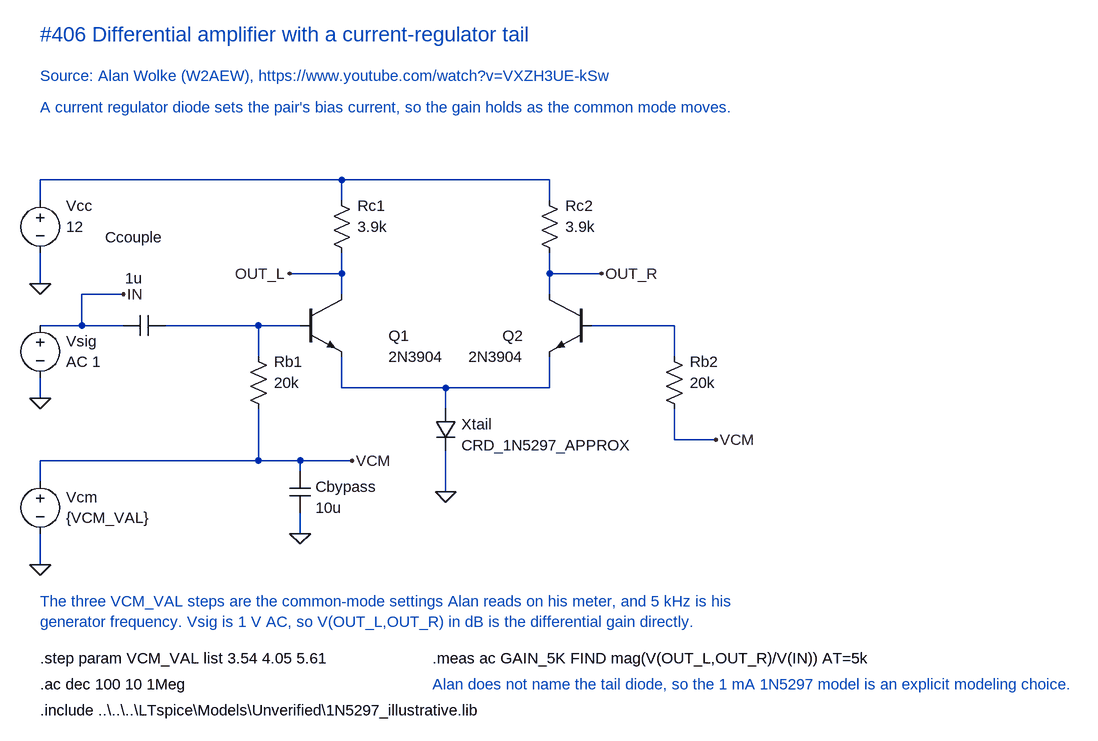
[diagram p0: schematic Differential amplifier - Current-regulator tail.asc]
Differential amplifier - Current-regulator tail.asc, the LTspice schematic file:
Version 4.1
SHEET 1 1500 1150
WIRE 96 272 96 304
WIRE 560 272 96 272
WIRE 880 272 560 272
WIRE 560 304 560 272
WIRE 880 304 880 272
WIRE 560 448 560 384
WIRE 880 448 880 384
WIRE 480 416 560 416
WIRE 960 416 880 416
WIRE 560 592 560 544
WIRE 880 592 560 592
WIRE 880 592 880 544
WIRE 720 624 720 592
WIRE 720 752 720 688
WIRE 224 496 96 496
WIRE 496 496 288 496
WIRE 432 544 432 496
WIRE 160 448 160 496
WIRE 224 448 160 448
WIRE 944 496 1072 496
WIRE 1072 496 1072 544
WIRE 432 704 432 624
WIRE 1072 672 1072 624
WIRE 1136 672 1072 672
WIRE 96 432 96 384
WIRE 96 608 96 576
WIRE 96 704 96 736
WIRE 496 704 96 704
WIRE 576 704 496 704
WIRE 496 720 496 704
WIRE 496 816 496 784
WIRE 96 864 96 816
FLAG 96 432 0
FLAG 96 608 0
FLAG 96 864 0
FLAG 496 816 0
FLAG 720 752 0
FLAG 224 448 IN
FLAG 480 416 OUT_L
FLAG 960 416 OUT_R
FLAG 576 704 VCM
FLAG 1136 672 VCM
SYMBOL voltage 96 288 R0
WINDOW 0 40 24 Left 2
WINDOW 3 40 56 Left 2
SYMATTR InstName Vcc
SYMATTR Value 12
SYMBOL voltage 96 480 R0
WINDOW 0 40 40 Left 2
WINDOW 3 40 72 Left 2
SYMATTR InstName Vsig
SYMATTR Value AC 1
SYMBOL voltage 96 720 R0
WINDOW 0 40 40 Left 2
WINDOW 3 40 72 Left 2
SYMATTR InstName Vcm
SYMATTR Value {VCM_VAL}
SYMBOL cap 288 480 R90
WINDOW 0 -104 48 VBottom 2
WINDOW 3 -72 48 VTop 2
SYMATTR InstName Ccouple
SYMATTR Value 1u
SYMBOL cap 480 720 R0
WINDOW 0 40 24 Left 2
WINDOW 3 40 56 Left 2
SYMATTR InstName Cbypass
SYMATTR Value 10u
SYMBOL res 544 288 R0
WINDOW 0 40 24 Left 2
WINDOW 3 40 56 Left 2
SYMATTR InstName Rc1
SYMATTR Value 3.9k
SYMBOL res 864 288 R0
WINDOW 0 40 24 Left 2
WINDOW 3 40 56 Left 2
SYMATTR InstName Rc2
SYMATTR Value 3.9k
SYMBOL npn 496 448 R0
WINDOW 0 136 64 Left 2
WINDOW 3 136 96 Left 2
SYMATTR InstName Q1
SYMATTR Value 2N3904
SYMBOL npn 944 448 M0
WINDOW 0 104 64 Left 2
WINDOW 3 104 96 Left 2
SYMATTR InstName Q2
SYMATTR Value 2N3904
SYMBOL res 416 528 R0
WINDOW 0 40 24 Left 2
WINDOW 3 40 56 Left 2
SYMATTR InstName Rb1
SYMATTR Value 20k
SYMBOL res 1056 528 R0
WINDOW 0 40 24 Left 2
WINDOW 3 40 56 Left 2
SYMATTR InstName Rb2
SYMATTR Value 20k
SYMBOL diode 704 624 R0
WINDOW 0 40 24 Left 2
WINDOW 3 40 56 Left 2
SYMATTR Prefix X
SYMATTR InstName Xtail
SYMATTR Value CRD_1N5297_APPROX
TEXT 96 48 Left 3 ;#406 Differential amplifier with a current-regulator tail
TEXT 96 112 Left 2 ;Source: Alan Wolke (W2AEW), https://www.youtube.com/watch?v=VXZH3UE-kSw
TEXT 96 160 Left 2 ;A current regulator diode sets the pair's bias current, so the gain holds as the common mode moves.
TEXT 96 920 Left 2 ;The three VCM_VAL steps are the common-mode settings Alan reads on his meter, and 5 kHz is his
TEXT 96 952 Left 2 ;generator frequency. Vsig is 1 V AC, so V(OUT_L,OUT_R) in dB is the differential gain directly.
TEXT 96 1008 Left 2 !.step param VCM_VAL list 3.54 4.05 5.61
TEXT 96 1048 Left 2 !.ac dec 100 10 1Meg
TEXT 96 1088 Left 2 !.include ..\..\..\LTspice\Models\Unverified\1N5297_illustrative.lib
TEXT 700 1048 Left 2 ;Alan does not name the tail diode, so the 1 mA 1N5297 model is an explicit modeling choice.
TEXT 700 1008 Left 2 !.meas ac GAIN_5K FIND mag(V(OUT_L,OUT_R)/V(IN)) AT=5k

The netlist it stands for:
* Differential amplifier - Current-regulator tail.asc
Vcc N001 0 12
Vsig IN 0 AC 1
Vcm VCM 0 {VCM_VAL}
Ccouple N003 IN 1u
Cbypass VCM 0 10u
Rc1 N001 OUT_L 3.9k
Rc2 N001 OUT_R 3.9k
Q1 OUT_L N003 N002 0 2N3904
Q2 OUT_R N004 N002 0 2N3904
Rb1 N003 VCM 20k
Rb2 N004 VCM 20k
X§Xtail N002 0 CRD_1N5297_APPROX  ; pins + -
.model NPN NPN
.model PNP PNP
.lib standard.bjt
* #406 Differential amplifier with a current-regulator tail
* Source: Alan Wolke (W2AEW), https://www.youtube.com/watch?v=VXZH3UE-kSw
* A current regulator diode sets the pair's bias current, so the gain holds as the common mode moves.
* The three VCM_VAL steps are the common-mode settings Alan reads on his meter, and 5 kHz is his
* generator frequency. Vsig is 1 V AC, so V(OUT_L,OUT_R) in dB is the differential gain directly.
.step param VCM_VAL list 3.54 4.05 5.61
.ac dec 100 10 1Meg
.include ..\..\..\LTspice\Models\Unverified\1N5297_illustrative.lib
* Alan does not name the tail diode, so the 1 mA 1N5297 model is an explicit modeling choice.
.meas ac GAIN_5K FIND mag(V(OUT_L,OUT_R)/V(IN)) AT=5k
.backanno
.end